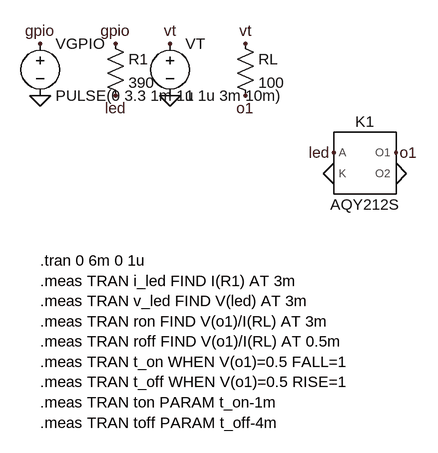
[diagram p0: schematic Model_test_AQY212S.asc]
Model_test_AQY212S.asc, the LTspice schematic file:
Version 4
SHEET 1 1400 700
SYMBOL AQY212S 600 300 R0
SYMATTR InstName K1
FLAG 552 284 led
FLAG 552 316 0
FLAG 648 284 o1
FLAG 648 316 0
SYMBOL voltage 100 100 R0
SYMATTR InstName VGPIO
SYMATTR Value PULSE(0 3.3 1m 1u 1u 3m 10m)
FLAG 100 116 gpio
FLAG 100 196 0
SYMBOL res 200 100 R0
SYMATTR InstName R1
SYMATTR Value 390
FLAG 216 116 gpio
FLAG 216 196 led
SYMBOL voltage 300 100 R0
SYMATTR InstName VT
SYMATTR Value 1
FLAG 300 116 vt
FLAG 300 196 0
SYMBOL res 400 100 R0
SYMATTR InstName RL
SYMATTR Value 100
FLAG 416 116 vt
FLAG 416 196 o1
TEXT 100 450 Left 2 !.tran 0 6m 0 1u\n.meas TRAN i_led FIND I(R1) AT 3m\n.meas TRAN v_led FIND V(led) AT 3m\n.meas TRAN ron FIND V(o1)/I(RL) AT 3m\n.meas TRAN roff FIND V(o1)/I(RL) AT 0.5m\n.meas TRAN t_on WHEN V(o1)=0.5 FALL=1\n.meas TRAN t_off WHEN V(o1)=0.5 RISE=1\n.meas TRAN ton PARAM t_on-1m\n.meas TRAN toff PARAM t_off-4m

The netlist it stands for:
* Model_test_AQY212S.asc
XK1 led 0 o1 0 AQY212S  ; pins A K O1 O2
VGPIO gpio 0 PULSE(0 3.3 1m 1u 1u 3m 10m)
R1 gpio led 390
VT vt 0 1
RL vt o1 100
.tran 0 6m 0 1u
.meas TRAN i_led FIND I(R1) AT 3m
.meas TRAN v_led FIND V(led) AT 3m
.meas TRAN ron FIND V(o1)/I(RL) AT 3m
.meas TRAN roff FIND V(o1)/I(RL) AT 0.5m
.meas TRAN t_on WHEN V(o1)=0.5 FALL=1
.meas TRAN t_off WHEN V(o1)=0.5 RISE=1
.meas TRAN ton PARAM t_on-1m
.meas TRAN toff PARAM t_off-4m
.lib C:\Users\polus\OneDrive\Pulpit\Projekty\Oscyloskop\Symulacje\AQY212S.lib
.backanno
.end